# Altium schematic sheet CON_PCI_Express_X4_64PIN.SchDoc: PCI Express x4 64Pin
size A4
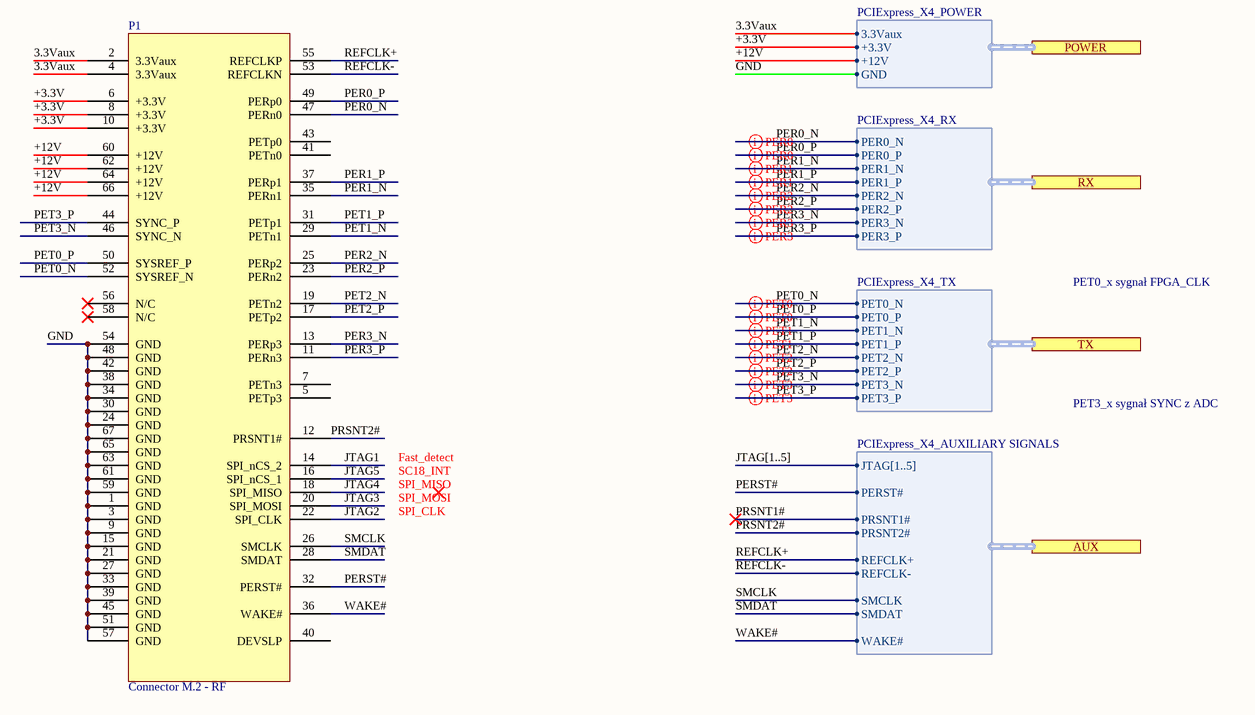
[diagram p0: CON_PCI_Express_X4_64PIN.SchDoc]

## Parts
P1  Connector M.2 - RF  [Connector M.2 Key M]

## Ports
AUX (harness PCIExpress_X4_AUXILIARY SIGNALS), POWER (harness PCIExpress_X4_POWER), RX (harness PCIExpress_X4_RX), TX (harness PCIExpress_X4_TX)

## Harnesses
PCIExpress_X4_RX: PER0_N, PER0_P, PER1_N, PER1_P, PER2_N, PER2_P, PER3_N, PER3_P
PCIExpress_X4_TX: PET0_N, PET0_P, PET1_N, PET1_P, PET2_N, PET2_P, PET3_N, PET3_P
PCIExpress_X4_POWER: +3.3V, +12V, GND, 3.3Vaux
PCIExpress_X4_AUXILIARY SIGNALS: JTAG[1..5], PERST#, PRSNT1#, PRSNT2#, REFCLK+, REFCLK-, SMCLK, SMDAT, WAKE#

## Nets
3.3Vaux: P1.2(3.3Vaux) P1.4(3.3Vaux) ; port POWER.3.3Vaux
+3.3V: P1.6(+3.3V) P1.8(+3.3V) P1.10(+3.3V) ; port POWER.+3.3V
+12V: P1.60(+12V) P1.62(+12V) P1.64(+12V) P1.66(+12V) ; port POWER.+12V
GND: P1.1(GND) P1.3(GND) P1.9(GND) P1.15(GND) P1.21(GND) P1.24(GND) P1.27(GND) P1.30(GND) P1.33(GND) P1.34(GND) P1.38(GND) P1.39(GND) P1.42(GND) P1.45(GND) P1.48(GND) P1.51(GND) P1.54(GND) P1.57(GND) P1.59(GND) P1.61(GND) P1.63(GND) P1.65(GND) P1.67(GND) ; port POWER.GND
JTAG1: P1.14(SPI_nCS_2)
JTAG2: P1.22(SPI_CLK)
JTAG3: P1.20(SPI_MOSI)
JTAG4: P1.18(SPI_MISO)
JTAG5: P1.16(SPI_nCS_1)
PER0_N: P1.47(PERn0) ; port RX.PER0_N
PER0_P: P1.49(PERp0) ; port RX.PER0_P
PER1_N: P1.35(PERn1) ; port RX.PER1_N
PER1_P: P1.37(PERp1) ; port RX.PER1_P
PER2_N: P1.25(PERp2) ; port RX.PER2_N
PER2_P: P1.23(PERn2) ; port RX.PER2_P
PER3_N: P1.13(PERp3) ; port RX.PER3_N
PER3_P: P1.11(PERn3) ; port RX.PER3_P
PERST#: P1.32(PERST#) ; port AUX.PERST#
PET0_N: P1.52(SYSREF_N) ; port TX.PET0_N
PET0_P: P1.50(SYSREF_P) ; port TX.PET0_P
PET1_N: P1.29(PETn1) ; port TX.PET1_N
PET1_P: P1.31(PETp1) ; port TX.PET1_P
PET2_N: P1.19(PETn2) ; port TX.PET2_N
PET2_P: P1.17(PETp2) ; port TX.PET2_P
PET3_N: P1.46(SYNC_N) ; port TX.PET3_N
PET3_P: P1.44(SYNC_P) ; port TX.PET3_P
PRSNT1#: port AUX.PRSNT1#
PRSNT2#: P1.12(PRSNT1#) ; port AUX.PRSNT2#
REFCLK+: P1.55(REFCLKP) ; port AUX.REFCLK+
REFCLK-: P1.53(REFCLKN) ; port AUX.REFCLK-
SMCLK: P1.26(SMCLK) ; port AUX.SMCLK
SMDAT: P1.28(SMDAT) ; port AUX.SMDAT
WAKE#: P1.36(WAKE#) ; port AUX.WAKE#

Not connected (* = marked no-connect by the designer): P1 5(PETp3) 7(PETn3) 40(DEVSLP) 41(PETn0) 43(PETp0) 56(N/C)* 58(N/C)*

## Buses and harness runs
bus JTAG[1..5]

## Layout directives
differential pair: PER0_N, PER0_P, PER1_N, PER1_P, PER2_N, PER2_P, PER3_N, PER3_P, PET0_N, PET0_P, PET1_N, PET1_P, PET2_N, PET2_P, PET3_N, PET3_P

## Notes on the sheet
- PET0_x sygnał FPGA_CLK
- Fast_detect
- PET3_x sygnał SYNC z ADC
- SC18_INT
- SPI_MISO
- SPI_MOSI
- SPI_CLK
- Sheet Title
- Project Title
- Size:
- Date:
- A4
- Item:
- Time:
- Revision:
- Sheet
- of
- File:

## Library data of the parts
P1 = Connector M.2 - RF: Złącze M.2 dla kart radiowych PnPSystem - bez crossowania.